# EasyEDA Pro project ProPrj_STM32智能桌面宠物PCB_2024-12-31.epro

# Schematic stm32桌面宠物
Board Name: stm32桌面宠物; Create Date: 2024-12-03
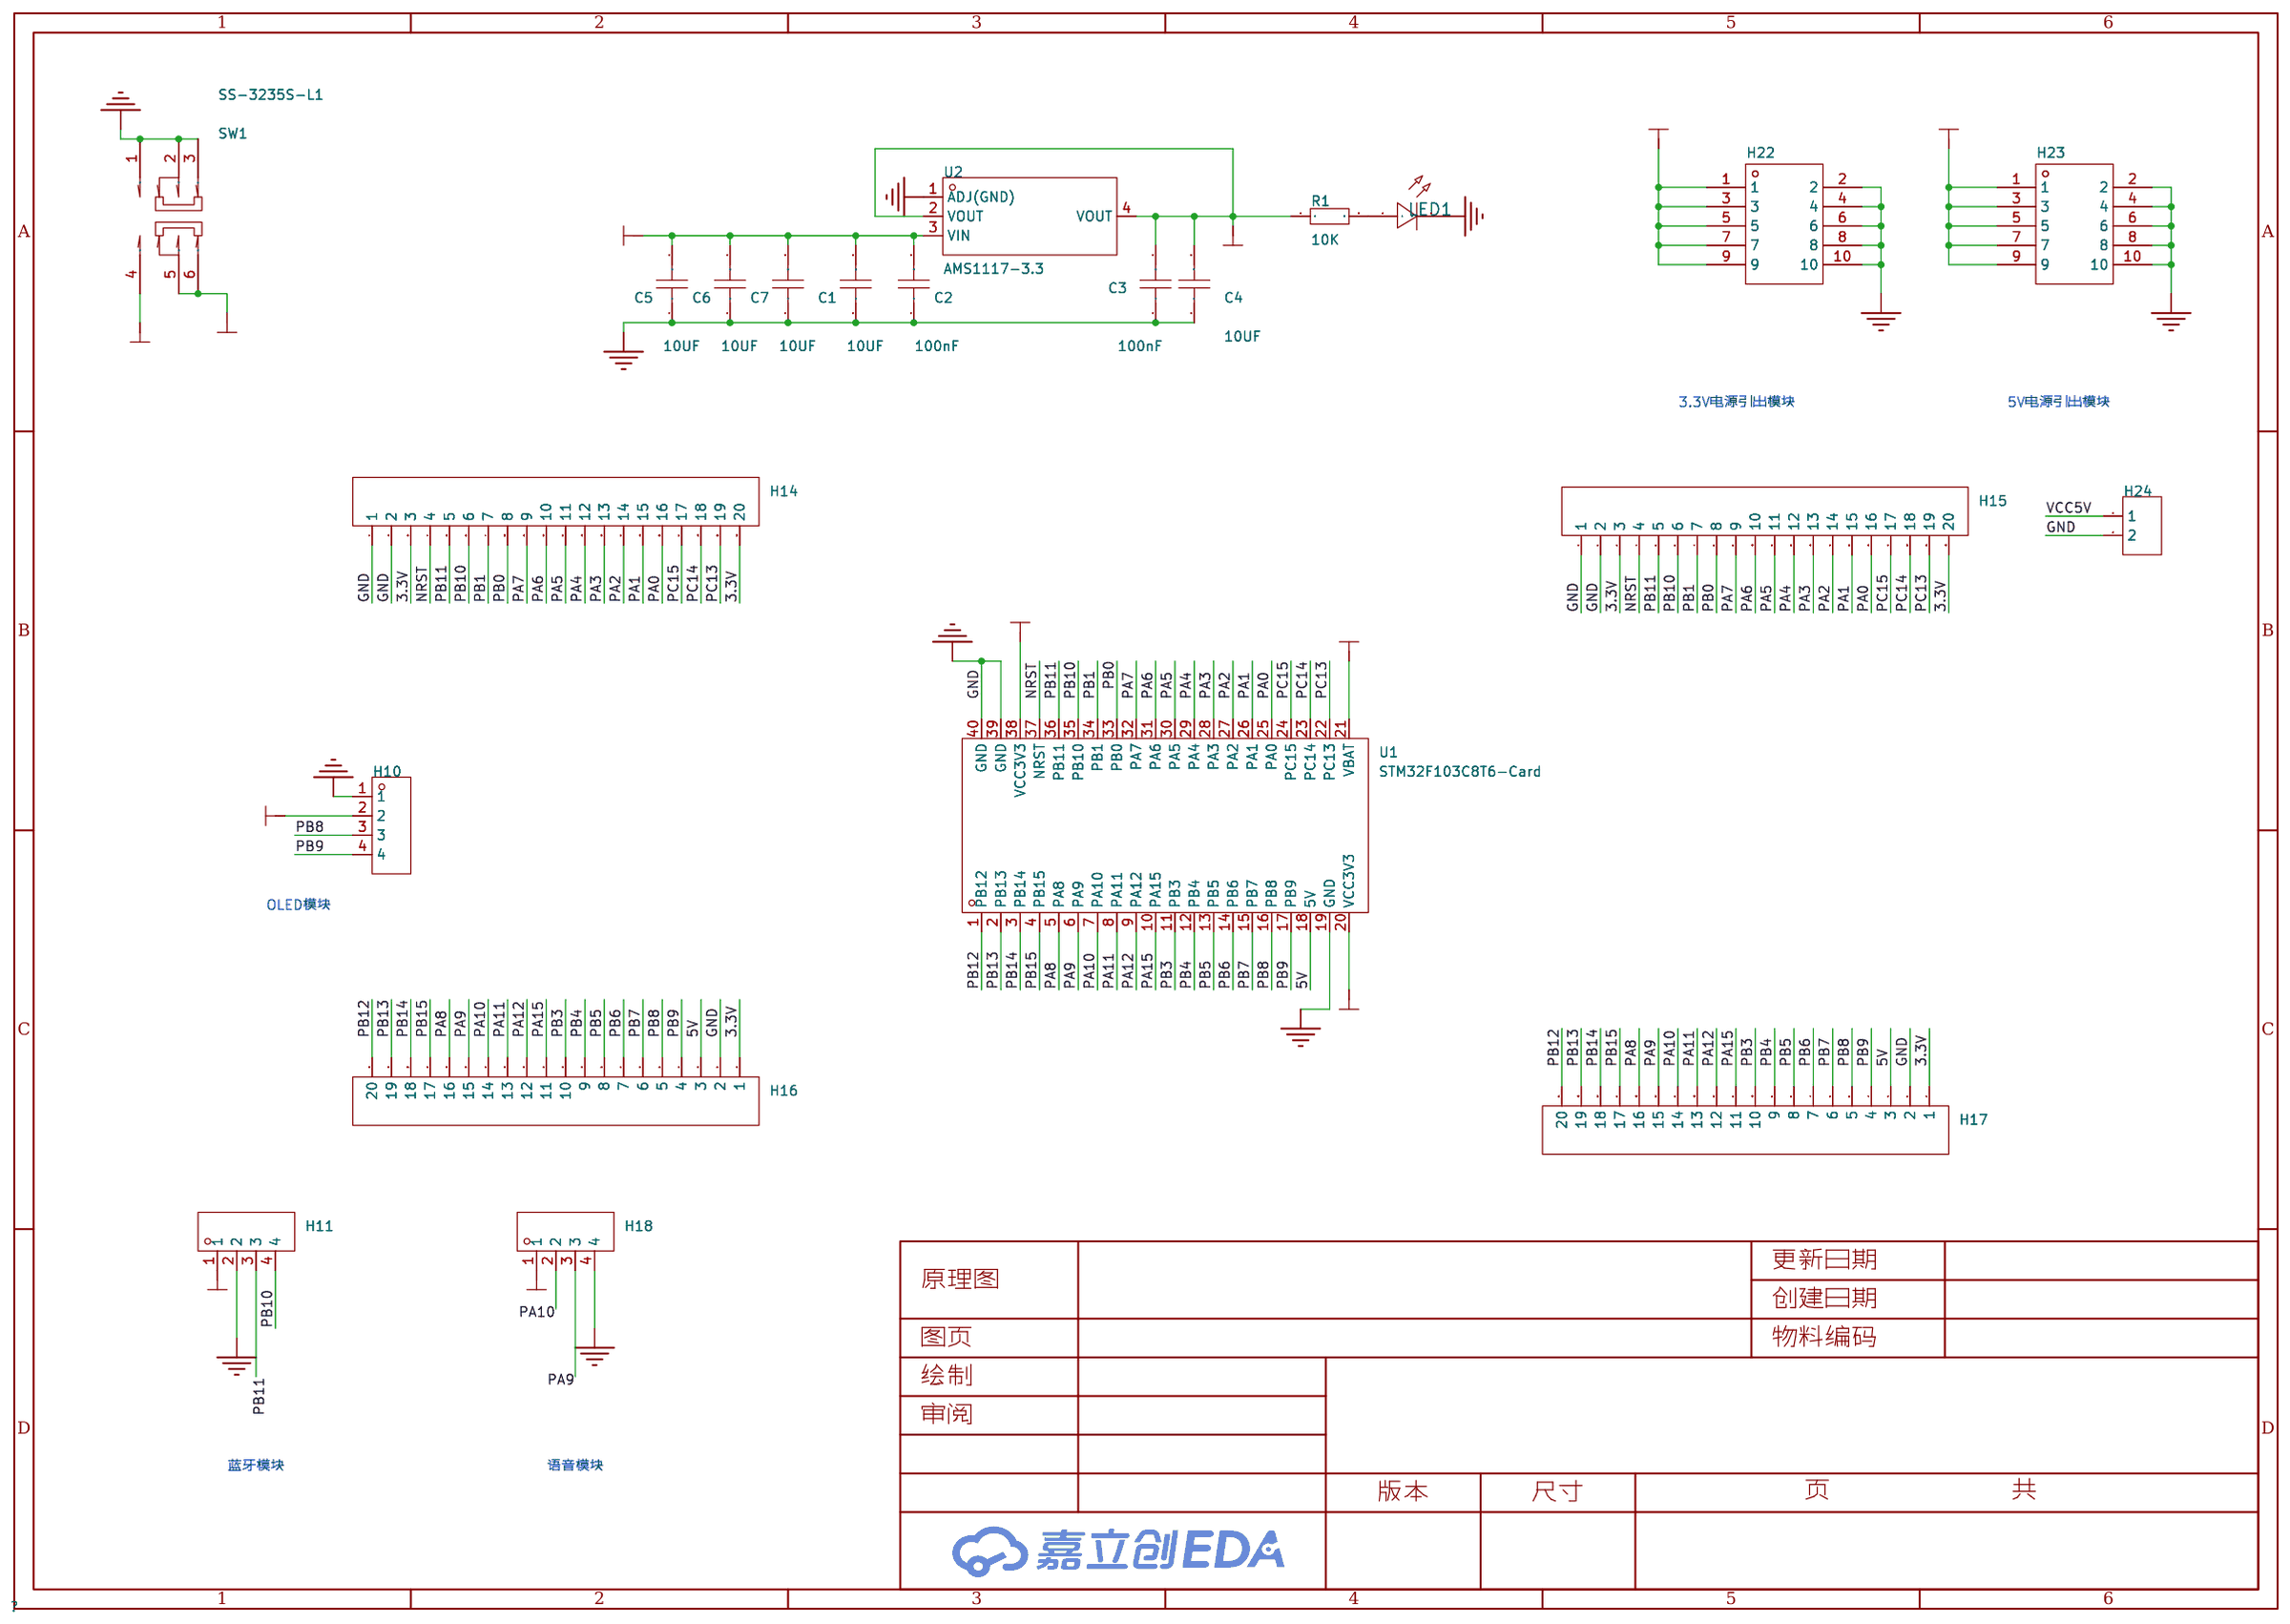
[diagram p0: schematic sheet]

## Parts
C1  10UF  [C0805]
C2  100nF  [C0805]
C3  100nF  [C0805]
C4  10UF  [C0805]
C5  10UF  [C0805]
C6  10UF  [C0805]
C7  10UF  [C0805]
H10  -  [HDR-TH_4P-P2.54-V-F]
H11  -  [HDR-TH_4P-P2.54-V-F]
H14  -  [HDR-TH_20P-P2.54-V-F]
H15  -  [HDR-TH_20P-P2.54-V-F]
H16  -  [HDR-TH_20P-P2.54-V-F]
H17  -  [HDR-TH_20P-P2.54-V-F]
H18  -  [HDR-TH_4P-P2.54-V-F]
H22  -  [HDR-TH_10P-P2.54-V-M-R2-C5-S2.54]
H23  -  [HDR-TH_10P-P2.54-V-M-R2-C5-S2.54]
H24  -  [HDR-TH_2P-P2.54-V-F]
LED1  -  [LED_0805]
R1  10K  [R0805]
SW1  SS-3235S-L1  [SW-SMD_SS-3235S-LX]
U1  STM32F103C8T6-Card  [CONN-TH_L53.3-W22.9_STM32F103C8T6-CARD]
U2  AMS1117-3.3  [SOT-223-3_L6.5-W3.4-P2.30-LS7.0-BR]

## Library data of the parts
C1-C7 = CAP_0805: Supplier Footprint: 0805
H10 H11 H18 = HDR-F_2.54_1x4P: Supplier Part: C2718488; Supplier Footprint: 插件
H14-H17 = HDR-F_2.54_1x20P: Supplier Part: C50984; Supplier Footprint: 插件
H22 H23 = HDR-M_2.54_2x5: Supplier Part: C124387; Supplier Footprint: 插件,P=2.54mm
H24 = HDR-F_2.54_1x2P: Supplier Part: C49661; Supplier Footprint: 插件
LED1 = LED_0805-R: Supplier Footprint: 0805
R1 = Res_0805: Supplier Footprint: 0805
SW1 = SS-3235S-L1: 电路结构:双刀双掷;安装方式:卧贴;开关颜色:黑色;额定电流(DC):50mA;额定电压(DC):12V;额定电流(AC):50mA;额定电压(AC):12V;机械寿命:1万次;; LCSC Part Name: 柄长2mm 卧贴双档 滑动开关; Supplier Part: C500055; Manufacturer: XKB Connectivity(中国星坤); Supplier Footprint: SMD; JLCPCB Part Class: 扩展库; Datasheet: https://atta.szlcsc.com/upload/public/pdf/source/20211011/39D516E750C13BE9339464E723D9F132.pdf; Supplier: LCSC; Circuit: 双刀双掷; Actuator Style: 矩形柱状; Pin Style: 鸥翼型; Switch Length: 9.1mm; Switch Width: 3.55mm; Switch Height: 3.2mm; Mounting Style: 卧贴; Actuator Color: 黑色; Current Rating (DC): 50mA; Voltage Rating (DC): 12V; Current Rating (AC): 50mA; Voltage Rating (AC): 12V; Mechanical Life: 1万次; Operating Temperature: -40℃~+85℃
U1 = STM32F103C8T6-Card: Supplier Part: C9900077949; Supplier Footprint: 插件; Supplier: LCSC
U2 = AMS1117-3.3: 输出类型:固定;最大输入电压:18V;输出电压:3.3V;最大输出电流:1A;电源纹波抑制比(PSRR):60dB@(120Hz);输出极性:正极;; LCSC Part Name: 输入18V 输出3.3V 1A; Supplier Part: C2891839; Manufacturer: YONGYUTAI(永裕泰); Supplier Footprint: SOT-223-3; JLCPCB Part Class: 扩展库; Datasheet: https://atta.szlcsc.com/upload/public/pdf/source/20210901/A75ADDE6A17DEE0002F2A58A8D1F3634.pdf; Supplier: LCSC; Output Type: 固定; Maximum Input Voltage: 18V; Output Voltage: 3.3V; MAX Output Current: 1A; Power Supply Rejection Ratio (PSRR): 60dB@(120Hz); Dropout Voltage: 1.3V@(1A); standby current: 5mA; Noise: 0.005%Vout; Operating Temperature: -40℃~+125℃@(Tj); Output Polarity: 正极; Number of Outputs: 1

## Nets
3.3V: C3.2 C4.2 H10.2 H11.1 H14.3 H14.20 H15.3 H15.20 H16.1 H17.1 H22.1 H22.3 H22.5 H22.7 H22.9 R1.1 U1.20(VCC3V3) U1.21(VBAT) U1.38(VCC3V3) U2.2(VOUT) U2.4(VOUT)
5V: C1.2 C2.2 C5.2 C6.2 C7.2 H16.3 H17.3 H18.1 H23.1 H23.3 H23.5 H23.7 H23.9 SW1.5 SW1.6 U1.18(5V) U2.3(VIN)
GND: C1.1 C2.1 C3.1 C4.1 C5.1 C6.1 C7.1 H10.1 H11.2 H14.1 H14.2 H15.1 H15.2 H16.2 H17.2 H18.4 H22.2 H22.4 H22.6 H22.8 H22.10 H23.2 H23.4 H23.6 H23.8 H23.10 H24.2 LED1.1(C) SW1.1 SW1.2 SW1.3 U1.19(GND) U1.39(GND) U1.40(GND) U2.1(ADJ(GND))
VCC5V: H24.1 SW1.4
NRST: H14.4 H15.4 U1.37(NRST)
PA0: H14.16 H15.16 U1.25(PA0)
PA1: H14.15 H15.15 U1.26(PA1)
PA2: H14.14 H15.14 U1.27(PA2)
PA3: H14.13 H15.13 U1.28(PA3)
PA4: H14.12 H15.12 U1.29(PA4)
PA5: H14.11 H15.11 U1.30(PA5)
PA6: H14.10 H15.10 U1.31(PA6)
PA7: H14.9 H15.9 U1.32(PA7)
PA8: H16.16 H17.16 U1.5(PA8)
PA9: H16.15 H17.15 H18.3 U1.6(PA9)
PA10: H16.14 H17.14 H18.2 U1.7(PA10)
PA11: H16.13 H17.13 U1.8(PA11)
PA12: H16.12 H17.12 U1.9(PA12)
PA15: H16.11 H17.11 U1.10(PA15)
PB0: H14.8 H15.8 U1.33(PB0)
PB1: H14.7 H15.7 U1.34(PB1)
PB3: H16.10 H17.10 U1.11(PB3)
PB4: H16.9 H17.9 U1.12(PB4)
PB5: H16.8 H17.8 U1.13(PB5)
PB6: H16.7 H17.7 U1.14(PB6)
PB7: H16.6 H17.6 U1.15(PB7)
PB8: H10.3 H16.5 H17.5 U1.16(PB8)
PB9: H10.4 H16.4 H17.4 U1.17(PB9)
PB10: H11.4 H14.6 H15.6 U1.35(PB10)
PB11: H11.3 H14.5 H15.5 U1.36(PB11)
PB12: H16.20 H17.20 U1.1(PB12)
PB13: H16.19 H17.19 U1.2(PB13)
PB14: H16.18 H17.18 U1.3(PB14)
PB15: H16.17 H17.17 U1.4(PB15)
PC13: H14.19 H15.19 U1.22(PC13)
PC14: H14.18 H15.18 U1.23(PC14)
PC15: H14.17 H15.17 U1.24(PC15)
$1N1622: LED1.2(A) R1.2

## Notes on the sheet
- 3.3V电源引出模块
- 5V电源引出模块
- OLED模块
- 蓝牙模块
- 语音模块

# Board stm32桌面宠物
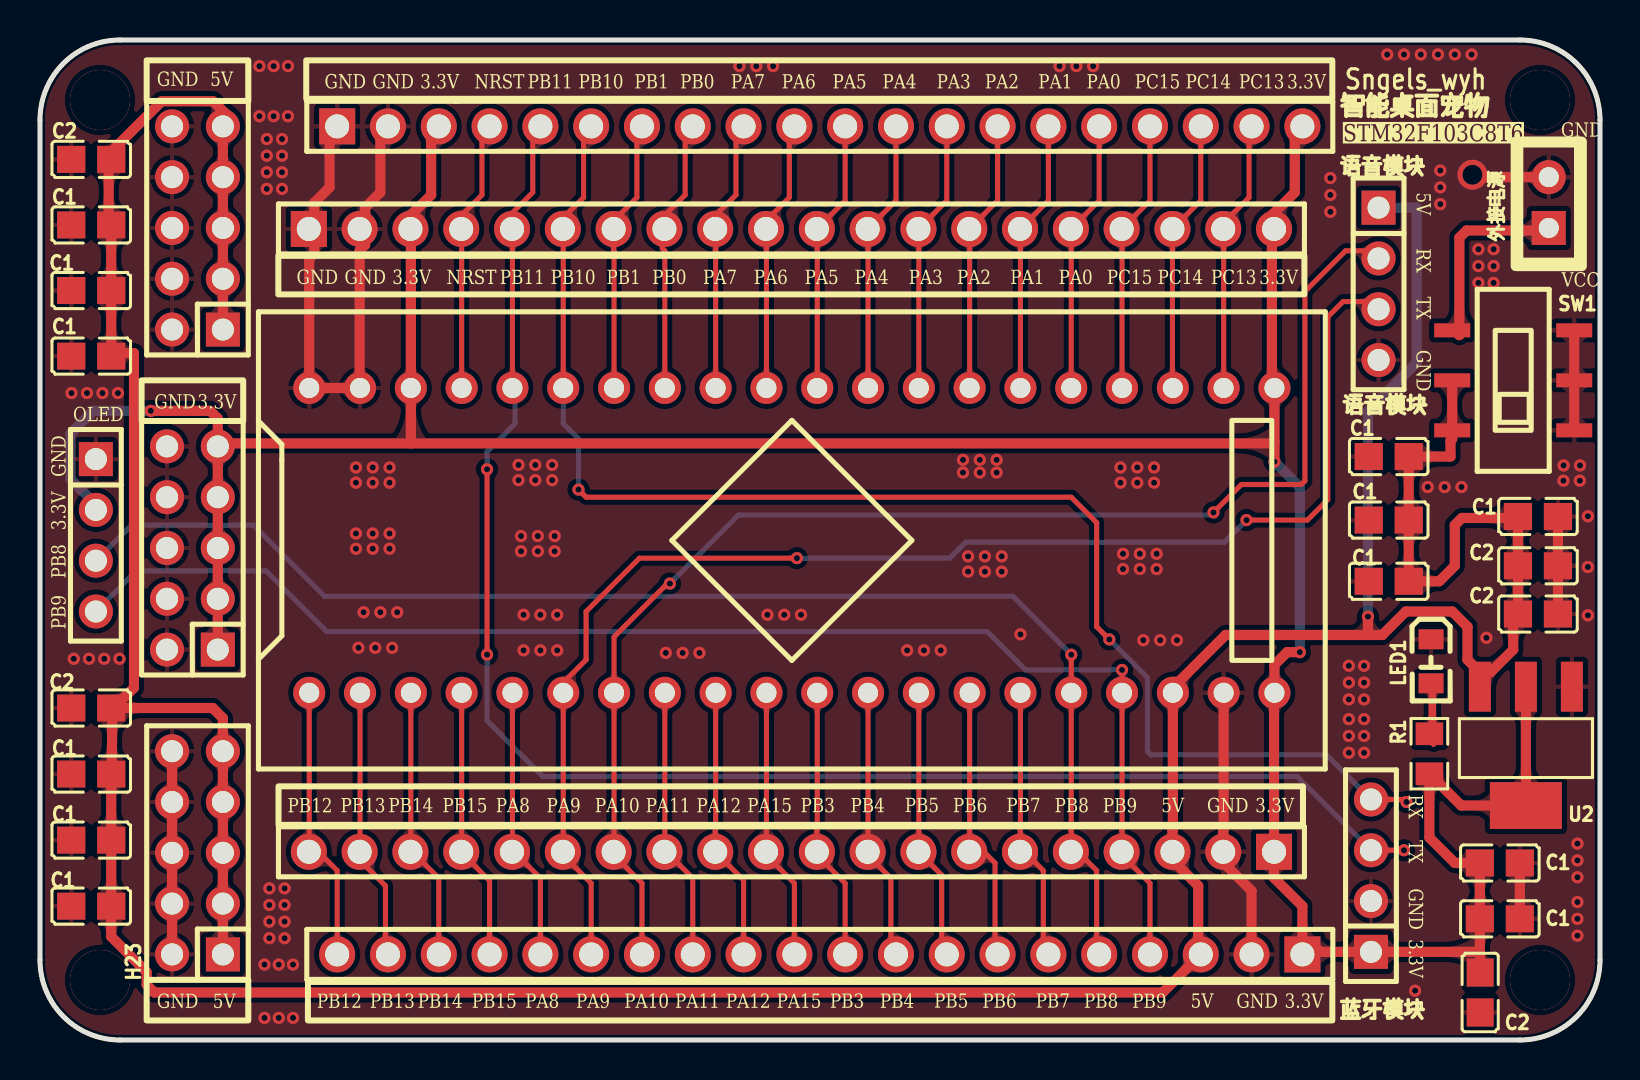
[diagram p1: board, top side]
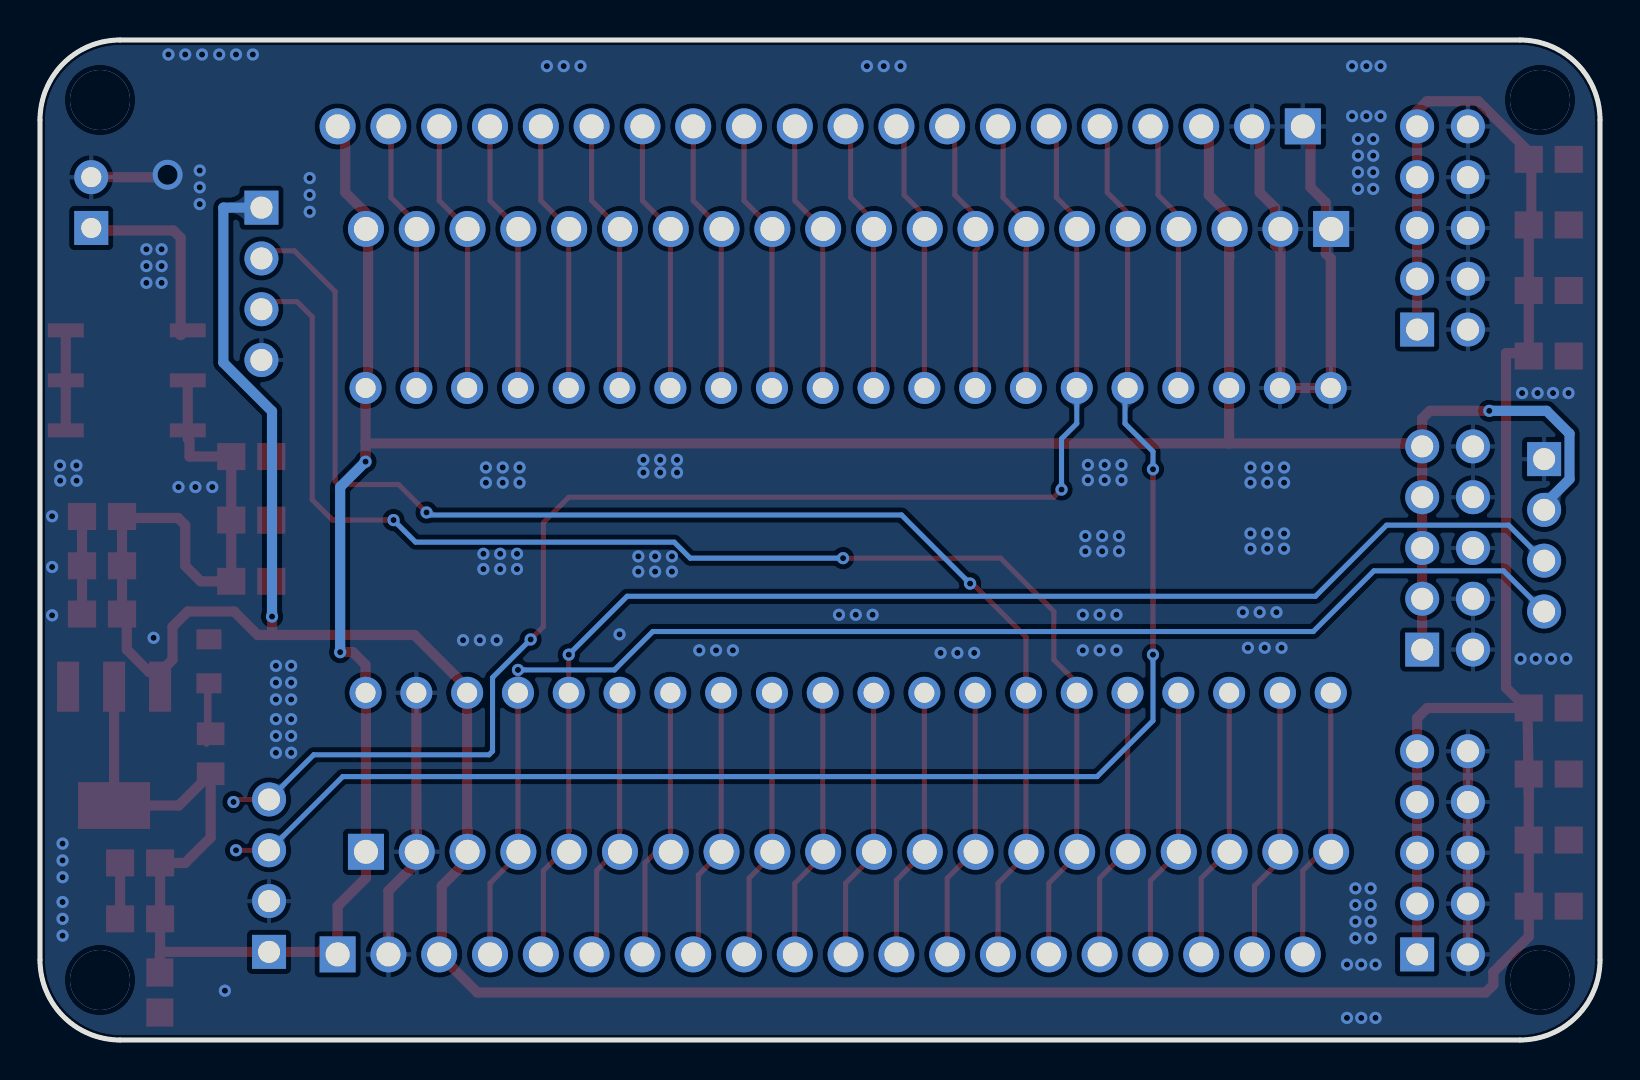
[diagram p2: board, bottom side, seen from below]

Outline 78 x 50 mm; copper layers: Top Layer, Bottom Layer. Coordinates in mm from the lower left corner of the outline.
Outline path: 0,46 0,4 arc(1.17,1.17) 4,0 74,0 arc(76.83,1.17) 78,4 78,46 arc(76.83,48.83) 74,50 4,50 arc(1.17,48.83) 0,46
Stack: Top Layer 0.035mm / Dielectric1 1.51mm FR4 er 4.5 / Bottom Layer 0.035mm

## Design rules (mm)
template: JLCPCB Capability(Two Layers Board)
spacing copperThickness1oz (default): track to track 0.102, other pairs 0.152 to 0.3
spacing copperThickness2oz: track to track 0.203, other pairs 0.152 to 0.3
track width copperThickness1oz (default): min 0.127, default 0.254, max 2.54
track width copperThickness2oz: min 0.203, default 0.254, max 2.54
differential pair differentialPair (default): width min 0.127, default 0.254, max 2.54; gap min 0.152, default 0.152
via viaSize (default): diameter min 0.5, default 0.61, max 10; hole min 0.3, default 0.305, max 6.3

## Placement (name value [footprint] x y rotation side)
C1  10UF  [C0805]  2.56 6.69 0 top
C1#2  -  [C0805]  74.9 26.18 180 top
C1#3  -  [C0805]  67.44 26 0 top
C1#4  -  [C0805]  67.44 29.17 0 top
C1#5  -  [C0805]  67.44 22.94 0 top
C1#6  -  [C0805]  2.56 13.3 0 top
C1#7  -  [C0805]  2.56 10 0 top
C1#8  -  [C0805]  2.56 40.75 0 top
C1#9  -  [C0805]  2.56 37.47 0 top
C1#10  -  [C0805]  72.99 6.06 180 top
C1#11  -  [C0805]  72.99 8.85 180 top
C1#12  -  [C0805]  2.56 34.19 0 top
C2  100nF  [C0805]  74.9 23.71 180 top
C2#2  -  [C0805]  74.9 21.3 180 top
C2#3  -  [C0805]  2.56 16.6 0 top
C2#4  -  [C0805]  2.56 44.03 0 top
C2#5  -  [C0805]  72.01 2.38 90 top
H10  -  [HDR-TH_4P-P2.54-V-F]  2.79 25.23 270 top
H11  -  [HDR-TH_4P-P2.54-V-F]  66.55 8.22 90 top
H14  -  [HDR-TH_20P-P2.54-V-F]  38.99 45.68 0 top
H15  -  [HDR-TH_20P-P2.54-V-F]  37.57 40.55 0 top
H16  -  [HDR-TH_20P-P2.54-V-F]  37.57 9.41 180 top
H17  -  [HDR-TH_20P-P2.54-V-F]  38.99 4.28 180 top
H18  -  [HDR-TH_4P-P2.54-V-F]  66.93 37.81 270 top
H22  -  [HDR-TH_10P-P2.54-V-M-R2-C5-S2.54]  7.62 24.6 90 top
H23  -  [HDR-TH_10P-P2.54-V-M-R2-C5-S2.54]  7.87 9.36 90 top
H23#2  -  [HDR-TH_10P-P2.54-V-M-R2-C5-S2.54]  7.87 40.6 90 top
H24  -  [HDR-TH_2P-P2.54-V-F]  75.44 41.87 90 top
LED1  -  [LED_0805]  69.55 18.89 270 top
R1  10K  [R0805]  69.47 14.31 90 top
SW1  SS-3235S-L1  [SW-SMD_SS-3235S-LX]  73.66 32.98 270 top
U1  STM32F103C8T6-Card  [CONN-TH_L53.3-W22.9_STM32F103C8T6-CARD]  37.59 24.98 0 top
U2  AMS1117-3.3  [SOT-223-3_L6.5-W3.4-P2.30-LS7.0-BR]  74.29 14.69 90 top

## Footprints (pads in the part's own frame, mm; a bottom-side part is the same pattern mirrored in y, then rotated)
C0805
  rect 1.41x1.35 smd: 1(-1,0) 2(1,0)
CONN-TH_L53.3-W22.9_STM32F103C8T6-CARD
  round 1.6 hole 1: 1(-24.13,-7.62) 2(-21.59,-7.62) 3(-19.05,-7.62) 4(-16.51,-7.62) 5(-13.97,-7.62) 6(-11.43,-7.62) 7(-8.89,-7.62) 8(-6.35,-7.62) 9(-3.81,-7.62) 10(-1.27,-7.62) 11(1.27,-7.62) 12(3.81,-7.62) 13(6.35,-7.62) 14(8.89,-7.62) 15(11.43,-7.62) 16(13.97,-7.62) 17(16.51,-7.62) 18(19.05,-7.62) 19(21.59,-7.62) 20(24.13,-7.62) 21(24.13,7.62) 22(21.59,7.62) 23(19.05,7.62) 24(16.51,7.62) 25(13.97,7.62) 26(11.43,7.62) 27(8.89,7.62) 28(6.35,7.62) 29(3.81,7.62) 30(1.27,7.62) 31(-1.27,7.62) 32(-3.81,7.62) 33(-6.35,7.62) 34(-8.89,7.62) 35(-11.43,7.62) 36(-13.97,7.62) 37(-16.51,7.62) 38(-19.05,7.62) 39(-21.59,7.62) 40(-24.13,7.62)
HDR-TH_2P-P2.54-V-F
  rect 1.7x1.7 hole 1: 1(-1.27,0)
  round 1.7 hole 1: 2(1.27,0)
HDR-TH_4P-P2.54-V-F
  rect 1.7x1.7 hole 1.1: 1(-3.81,0)
  round 1.7 hole 1.1: 2(-1.27,0) 3(1.27,0) 4(3.81,0)
HDR-TH_10P-P2.54-V-M-R2-C5-S2.54
  rect 1.7x1.7 hole 1.1: 1(-5.08,-1.27)
  round 1.7 hole 1.1: 2(-5.08,1.27) 3(-2.54,-1.27) 4(-2.54,1.27) 5(0,-1.27) 6(0,1.27) 7(2.54,-1.27) 8(2.54,1.27) 9(5.08,-1.27) 10(5.08,1.27)
HDR-TH_20P-P2.54-V-F
  rect 1.8x1.8 hole 1.2: 1(-24.13,0)
  round 1.8 hole 1.2: 2(-21.59,0) 3(-19.05,0) 4(-16.51,0) 5(-13.97,0) 6(-11.43,0) 7(-8.89,0) 8(-6.35,0) 9(-3.81,0) 10(-1.27,0) 11(1.27,0) 12(3.81,0) 13(6.35,0) 14(8.89,0) 15(11.43,0) 16(13.97,0) 17(16.51,0) 18(19.05,0) 19(21.59,0) 20(24.13,0)
LED_0805
  rect 1x1.25 smd: 1(-1.15,0.005) 2(1.05,0.005)
R0805
  rect 1.133x1.377 smd: 1(-1,0) 2(1,0)
SOT-223-3_L6.5-W3.4-P2.30-LS7.0-BR
  rect 2.5x1.1 smd: 1(2.97,-2.3) 2(2.97,0) 3(2.97,2.3)
  rect 2.34x3.6 smd: 4(-2.97,0)
SW-SMD_SS-3235S-LX
  rect 0.7x1.8 smd: 1(-2.5,3.05) 2(0,3.05) 3(2.5,3.05) 4(-2.5,-3.05) 5(0,-3.05) 6(2.5,-3.05)

## Nets
As in the schematic, except:
3.3V: C1#10.2 C1#11.2 C2#5.2 H10.2 H11.1 H14.3 H14.20 H15.3 H15.20 H16.1 H17.1 H22.1 H22.3 H22.5 H22.7 H22.9 R1.1 U1.20 U1.21 U1.38 U2.2 U2.4
5V: C1.2 C1#2.2 C1#3.2 C1#4.2 C1#5.2 C1#6.2 C1#7.2 C1#8.2 C1#9.2 C1#12.2 C2.2 C2#2.2 C2#3.2 C2#4.2 H16.3 H17.3 H18.1 H23.1 H23.3 H23.5 H23.7 H23.9 H23#2.1 H23#2.3 H23#2.5 H23#2.7 H23#2.9 SW1.5 SW1.6 U1.18 U2.3
GND: C1.1 C1#2.1 C1#3.1 C1#4.1 C1#5.1 C1#6.1 C1#7.1 C1#8.1 C1#9.1 C1#10.1 C1#11.1 C1#12.1 C2.1 C2#2.1 C2#3.1 C2#4.1 C2#5.1 H10.1 H11.2 H14.1 H14.2 H15.1 H15.2 H16.2 H17.2 H18.4 H22.2 H22.4 H22.6 H22.8 H22.10 H23.2 H23.4 H23.6 H23.8 H23.10 H23#2.2 H23#2.4 H23#2.6 H23#2.8 H23#2.10 H24.2 LED1.1 SW1.1 SW1.2 SW1.3 U1.19 U1.39 U1.40 U2.1

## Via types
v1: diameter 3, hole 3, Top Layer to Bottom Layer, 4 vias
v2: diameter 0.61, hole 0.305, Top Layer to Bottom Layer, 179 vias
v3: diameter 1.5, hole 1, Top Layer to Bottom Layer, 1 via

## Routing (per net, layer and track width the routed paths; a pad name or vN(x,y) marks a point on that pad's centre or on a via; arc(x,y) is an arc through that point)
3.3V: length 169.9
  Top Layer w0.508: 62.74,45.68 62.74,42.38 61.59,41.24 61.59,32.73 U1.21 61.72,29.88 ; H17.1 62.74,4.66 62.99,4.66 ; 71.88,4.41 H11.1 64.01,4.41 63.75,4.66 62.99,4.66 ; 71.88,4.41 71.99,4.41 C1#10.2 71.99,8.61 71.75,8.85 ; 71.88,4.41 72.01,4.28 C2#5.2 ; 71.75,8.85 70.74,8.85 69.47,10.12 R1.1 71.06,11.72 U2.4 U2.2 ; 71.75,8.85 C1#11.2 ; 18.54,29.83 U1.38 18.54,41.24 19.56,42.25 19.56,45.68 ; 18.54,29.83 61.68,29.83 61.72,29.88 ; 18.54,29.83 9.04,29.83 H22.9 ; 61.72,29.88 v2(61.72,28.92) ; 62.99,4.66 63.12,4.79 63.12,6.69 61.7,8.11 H16.1 61.7,17.34 U1.20 61.72,18.76 62.36,19.39 v2(62.99,19.39) ; 18.54,39.2 18.52,39.19 ; H22.9 H22.7 H22.5 H22.3 H22.1 ; H22.9 8.89,31.08 8.51,31.46 v2(5.54,31.46)
  Bottom Layer w0.508: v2(5.54,31.46) 2.67,31.46 1.52,30.31 1.52,28.04 2.79,26.77 H10.2 ; v2(61.72,28.92) 62.99,27.65 v2(62.99,19.39)
5V: length 221.7
  Top Layer w0.508: H23.1 H23.3 H23.5 H23.7 H23.9 9.14,16.09 8.64,16.6 4.19,16.6 4.12,16.67 ; 72,18.39 72.53,18.39 73.66,19.52 73.66,21.3 C2#2.2 C2.2 C1#2.2 73.82,26.1 71.1,26.1 70.74,25.74 70.74,23.71 69.96,22.94 C1#5.2 C1#3.2 C1#4.2 70.53,29.17 70.53,29.97 70.61,30.06 SW1.6 70.61,32.98 ; 72,18.39 72,17.66 ; 72,18.39 71.37,19.01 71.37,20.66 70.61,21.42 68.29,21.42 67.12,20.25 66.4,20.25 ; 3.56,34.34 4.7,34.34 4.7,17.61 3.94,16.85 4.12,16.67 ; 3.56,34.34 3.44,34.21 3.44,34.19 ; 3.56,34.34 C1#9.2 3.56,40.63 3.44,40.75 3.44,44.29 6.08,46.94 8.65,46.94 9.26,46.33 9.26,45.84 9.14,45.73 H23#2.9 H23#2.7 H23#2.5 H23#2.3 H23#2.1 ; 3.56,12.32 C1#7.2 C1.2 3.56,5.17 4.95,3.78 4.95,3.77 5.33,3.39 5.33,2.76 5.72,2.38 56.13,2.38 H17.3 57.91,4.41 57.91,7.71 56.9,8.72 56.9,9.14 H16.3 56.62,10.5 56.64,10.52 U1.18 56.64,17.61 59.28,20.25 66.4,20.25 ; 3.56,12.32 3.56,13.42 ; 3.56,12.32 3.63,16.53 C2#3.2 3.63,16.67 4.12,16.67 ; 66.4,20.25 v2(66.4,21.17)
  Bottom Layer w0.508: v2(66.4,21.17) 66.4,31.44 68.83,33.87 68.83,41.62 H18.1
GND: length 70.7
  Top Layer w0.508: H23.2 H23.4 H23.6 H23.8 H23.10 ; 15.98,32.11 16,32.09 ; 15.98,32.11 15.98,32.58 ; 15.98,32.11 15.49,32.6 U1.40 13.46,39.08 13.72,39.33 13.72,41.87 14.48,42.63 14.48,45.68 ; 15.98,32.58 15.98,39.48 16.26,39.75 16.26,41.62 17.02,42.38 17.02,45.68 ; 15.98,32.58 U1.39 ; U1.19 59.18,10.52 59.16,10.5 H16.2 59.18,9.39 59.18,8.85 60.58,7.45 H17.2 ; C2#2.1 C2.1 C1#2.1 ; H24.2 71.74,43.14 v3(71.62,43.26) ; C1#10.1 C1#11.1 ; SW1.3 SW1.2 SW1.1
  vias: v2(1.58,32.35) v2(1.69,19.06) v2(2.35,32.35) v2(2.45,19.06) v2(3.12,32.35) v2(3.21,19.06) v2(3.9,32.35) v2(3.97,19.06) v2(10.97,48.69) v2(10.97,46.19) v2(11.22,3.77) v2(11.22,1.1) v2(11.34,45.05) v2(11.34,44.22) v2(11.34,43.39) v2(11.34,42.56) v2(11.47,7.58) v2(11.47,6.75) v2(11.47,5.92) v2(11.47,5.09) v2(11.68,48.69) v2(11.68,46.19) v2(11.94,3.77) v2(11.94,1.1) v2(12.1,45.05) v2(12.1,44.22) v2(12.1,43.39) v2(12.1,42.56) v2(12.23,7.58) v2(12.23,6.75) v2(12.23,5.92) v2(12.23,5.09) v2(12.4,48.69) v2(12.4,46.19) v2(12.65,3.77) v2(12.65,1.1) v2(15.8,28.63) v2(15.8,27.86) v2(15.8,25.33) v2(15.8,24.56) v2(15.92,19.61) v2(16.18,21.39) v2(16.64,28.63) v2(16.64,27.86) v2(16.64,25.33) v2(16.64,24.56) v2(16.76,19.61) v2(17.02,21.39) v2(17.48,28.63) v2(17.48,27.86) v2(17.48,25.33) v2(17.48,24.56) v2(17.6,19.61) v2(17.86,21.39) v2(23.92,28.75) v2(23.92,27.99) v2(24.05,25.2) v2(24.05,24.44) v2(24.18,21.26) v2(24.18,19.48) v2(24.76,28.75) v2(24.76,27.99) v2(24.89,25.2) v2(24.89,24.44) v2(25.02,21.26) v2(25.02,19.48) v2(25.61,28.75) v2(25.61,27.99) v2(25.73,25.2) v2(25.73,24.44) v2(25.86,21.26) v2(25.86,19.48) v2(31.29,19.36) v2(32.13,19.36) v2(32.97,19.36) v2(34.97,48.69) v2(35.81,48.69) v2(36.37,21.26) v2(36.65,48.69) v2(37.21,21.26) v2(38.05,21.26) v2(43.36,19.48) v2(44.2,19.48) v2(45.04,19.48) v2(46.15,29.01) v2(46.15,28.37) v2(46.4,24.18) v2(46.4,23.42) v2(46.99,29.01) v2(46.99,28.37) v2(47.24,24.18) v2(47.24,23.42) v2(47.83,29.01) v2(47.83,28.37) v2(48.08,24.18) v2(48.08,23.42) v2(49.02,20.28) v2(50.98,48.69) v2(51.82,48.69) v2(52.66,48.69) v2(54.02,28.63) v2(54.02,27.86) v2(54.15,24.31) v2(54.15,23.55) v2(54.86,28.63) v2(54.86,27.86) v2(54.99,24.31) v2(54.99,23.55) v2(55.17,19.99) v2(55.7,28.63) v2(55.7,27.86) v2(55.83,24.31) v2(55.83,23.55) v2(56.01,19.99) v2(56.85,19.99) v2(64.52,43.1) v2(64.52,42.25) v2(64.52,41.41) v2(65.44,18.71) v2(65.44,17.87) v2(65.44,17.03) v2(65.44,16.04) v2(65.44,15.2) v2(65.44,14.36) v2(66.2,18.71) v2(66.2,17.87) v2(66.2,17.03) v2(66.2,16.04) v2(66.2,15.2) v2(66.2,14.36) v2(67.36,49.28) v2(68.2,49.28) v2(68.76,2.47) v2(69.04,49.28) v2(69.39,27.65) v2(69.9,49.28) v2(70.01,43.47) v2(70.01,42.63) v2(70.01,41.79) v2(70.23,27.65) v2(70.74,49.28) v2(71.07,27.65) v2(71.58,49.28) v2(71.92,39.54) v2(71.92,38.7) v2(71.92,37.86) v2(72.32,20.11) v2(72.68,39.54) v2(72.68,38.7) v2(72.68,37.86) v2(76.18,28.73) v2(76.17,27.97) v2(76.87,9.82) v2(76.87,8.98) v2(76.87,8.14) v2(76.87,6.9) v2(76.87,6.06) v2(76.87,5.22) v2(77,28.73) v2(76.99,27.97) v2(77.4,26.19) v2(77.4,23.65) v2(77.4,21.23)
VCC5V: length 10
  Top Layer w0.508: H24.1 75.31,40.47 71.33,40.47 70.97,40.12 70.97,35.24 70.73,35.48 SW1.4
(no net):
  vias: v1(3,47) v1(3,3) v1(75,47) v1(75,3)
NRST: length 13.5
  Top Layer w0.254: U1.37 21.08,41.24 22.1,42.25 22.1,45.68
PA0: length 13.7
  Top Layer w0.254: H14.16 52.96,41.97 H15.16 51.56,40.53 U1.25
PA1: length 13.7
  Top Layer w0.254: H14.15 50.42,41.97 H15.15 49.02,40.53 U1.26
PA2: length 13.7
  Top Layer w0.254: H14.14 47.88,41.97 H15.14 46.48,40.53 U1.27
PA3: length 13.7
  Top Layer w0.254: H14.13 45.34,41.97 H15.13 43.94,40.53 U1.28
PA4: length 13.7
  Top Layer w0.254: U1.29 41.4,40.53 H15.12 42.8,41.97 H14.12
PA5: length 13.7
  Top Layer w0.254: U1.30 38.86,40.53 H15.11 40.26,41.97 H14.11
PA6: length 13.6
  Top Layer w0.254: U1.31 36.32,40.98 37.47,42.13 37.47,45.56 37.34,45.68
PA7: length 13.5
  Top Layer w0.254: 34.8,45.68 34.8,42.25 33.78,41.24 33.78,39.48 33.76,39.48 33.78,39.46 U1.32
PA8: length 13.7
  Top Layer w0.254: U1.5 23.62,9.49 25.02,8.09 H17.16
PA9: length 69.8
  Top Layer w0.254: v2(37.85,24.09) 29.97,24.09 27.31,21.42 27.31,19.01 26.16,17.87 U1.6 26.16,9.23 27.56,7.84 H17.15 ; H18.3 66.55,36.92 65.15,36.92 64.39,36.16 64.39,27.01 63.37,26 v2(60.32,26)
  Bottom Layer w0.254: v2(60.32,26) 59.22,24.89 46.29,24.89 45.49,24.09 v2(37.85,24.09)
PA10: length 68.6
  Top Layer w0.254: H18.2 66.55,39.46 65.28,39.46 63.25,37.43 63.25,27.95 63.07,27.78 60.07,27.78 v2(58.67,26.38) ; v2(31.5,22.82) 31.37,22.82 28.7,20.16 U1.7 28.7,10.25 28.45,10 28.7,9.74 28.7,9.23 30.1,7.84 H17.14
  Bottom Layer w0.254: v2(31.5,22.82) 34.93,26.25 58.55,26.25 v2(58.67,26.38)
PA11: length 13.7
  Top Layer w0.254: H17.13 32.64,8.09 31.24,9.49 U1.8
PA12: length 13.7
  Top Layer w0.254: H17.12 35.18,7.99 H16.12 33.76,10.5 33.78,10.52 U1.9
PA15: length 13.8
  Top Layer w0.254: U1.10 36.32,10.25 36.13,10.06 36.58,9.61 36.58,8.98 37.72,7.84 H17.11
PB0: length 13.6
  Top Layer w0.254: U1.33 31.24,39.46 31.12,39.59 31.12,40.73 31.37,40.98 31.37,41.36 32.26,42.25 32.26,45.68
PB1: length 13.6
  Top Layer w0.254: 29.72,45.68 29.84,45.56 29.84,42.13 28.68,40.96 H15.7 28.68,39.48 28.7,39.46 U1.34
PB3: length 13.7
  Top Layer w0.254: H17.10 40.26,7.84 38.86,9.23 38.86,10 38.84,10.02 38.84,10.5 38.86,10.52 U1.11
PB4: length 13.7
  Top Layer w0.254: U1.12 41.4,10.19 41.37,10.16 41.62,9.9 41.62,9.02 42.54,8.09 42.54,4.53 H17.9
PB5: length 13.7
  Top Layer w0.254: H17.8 45.09,4.53 45.09,8.25 43.94,9.39 U1.13
PB6: length 13.7
  Top Layer w0.254: U1.14 46.48,10.52 46.46,10.5 46.48,10.48 46.48,10.12 47.75,8.85 47.75,4.41 H17.7
PB7: length 13.7
  Top Layer w0.254: H17.6 50.16,4.53 50.16,8.47 49.02,9.61 49.02,10.48 49,10.5 49.02,10.52 U1.15
PB8: length 67.8
  Top Layer w0.254: H17.5 52.83,4.41 52.83,8.47 51.56,9.74 51.56,10.48 51.54,10.5 51.56,10.52 U1.16 v2(51.56,19.27)
  Bottom Layer w0.254: H10.3 4.57,25.74 10.67,25.74 14.22,22.19 48.64,22.19 v2(51.56,19.27)
PB9: length 69
  Top Layer w0.254: H17.4 55.5,7.84 54.1,9.23 54.1,10.48 54.08,10.5 54.1,10.52 U1.17 v2(54.1,18.5)
  Bottom Layer w0.254: H10.4 4.83,23.46 11.3,23.46 14.34,20.42 47.36,20.42 49.28,18.5 v2(54.1,18.5)
PB10: length 72
  Top Layer w0.254: v2(26.92,27.52) 27.31,27.14 51.56,27.14 52.83,25.87 52.83,20.66 v2(53.47,20.03) ; v2(68.33,11.9) 68.2,12.03 H11.4 ; 27.18,45.68 27.18,42.13 26.16,41.11 U1.35
  Bottom Layer w0.254: v2(26.92,27.52) 26.92,30.06 26.16,30.82 U1.35 ; v2(53.47,20.03) 55.37,18.12 55.37,14.44 55.55,14.26 64.31,14.26 H11.4
PB11: length 79.3
  Top Layer w0.254: v2(22.35,19.27) v2(22.35,28.54) ; H11.3 v2(68.2,9.49) ; U1.36 23.62,41.36 24.64,42.38 24.64,45.68
  Bottom Layer w0.254: U1.36 23.75,32.47 23.75,30.82 22.35,29.43 v2(22.35,28.54) ; v2(22.35,19.27) 22.35,15.96 25.15,13.17 62.87,13.17 H11.3
PB12: length 13.8
  Top Layer w0.254: U1.1 13.46,10.12 13.33,10 14.86,8.47 H17.20
PB13: length 13.7
  Top Layer w0.254: H17.19 17.27,4.41 17.27,7.71 16,8.98 U1.2
PB14: length 14
  Top Layer w0.254: H17.18 19.94,8.09 18.16,9.87 18.54,10.25 U1.3
PB15: length 14
  Top Layer w0.254: H17.17 22.48,7.96 20.7,9.74 21.08,10.12 U1.4
PC13: length 13.7
  Top Layer w0.254: U1.22 59.18,40.53 H15.19 59.16,40.84 60.45,42.13 60.45,45.56 H14.19
PC14: length 13.7
  Top Layer w0.254: U1.23 56.62,32.62 H15.18 58.04,41.97 H14.18
PC15: length 13.7
  Top Layer w0.254: H14.17 55.5,41.97 H15.17 54.1,40.53 U1.24
$1N1622: length 6.5
  Top Layer w0.254: 69.6,14.86 69.68,14.95 69.68,17.58 ; 69.6,14.86 69.55,14.91 ; 69.6,14.86 69.68,14.78 ; 69.6,14.86 69.6,15.06 ; LED1.2 69.55,14.91 ; 69.55,14.91 69.47,14.99 R1.2

## Copper pours and planes (outline as drawn; the poured copper is in the pictures)
GND on Top Layer: -29.21,75.02 112.14,75.02 112.14,-18.2 -29.21,-18.2
GND on Top Layer: -9.02,58.51 97.28,58.51 97.28,-9.94 -9.02,-9.94
GND on Bottom Layer: -12.06,62.32 102.36,62.32 102.36,-12.74 -12.06,-12.74
GND on Bottom Layer: -11.05,59.91 91.95,59.91 91.95,-5.88 -11.05,-5.88

Small or netless copper shapes (teardrops, artwork), in the pictures only: 279 on Top Layer, 22 on Bottom Layer

## Text on the board
Top Silkscreen Layer: Sngels_wyh | OLED | GND | 3.3V | 5V | PB12 | PB13 | PB14 | PB15 | NRST | PA8 | PB11 | PA9 | PB10 | PA10 | PB1 | PA11 | PB0 | PA12 | PA7 | PA15 | PA6 | PB3 | PA5 | PB4 | PA4 | PB5 | PA3 | PB6 | PA2 | PB7 | PA1 | PB8 | PA0 | PB9 | PC15 | PC14 | PC13 | VCC | RX | TX | 外接电源 | 蓝牙模块 | 语音模块 | 智能桌面宠物 | STM32F103C8T6
